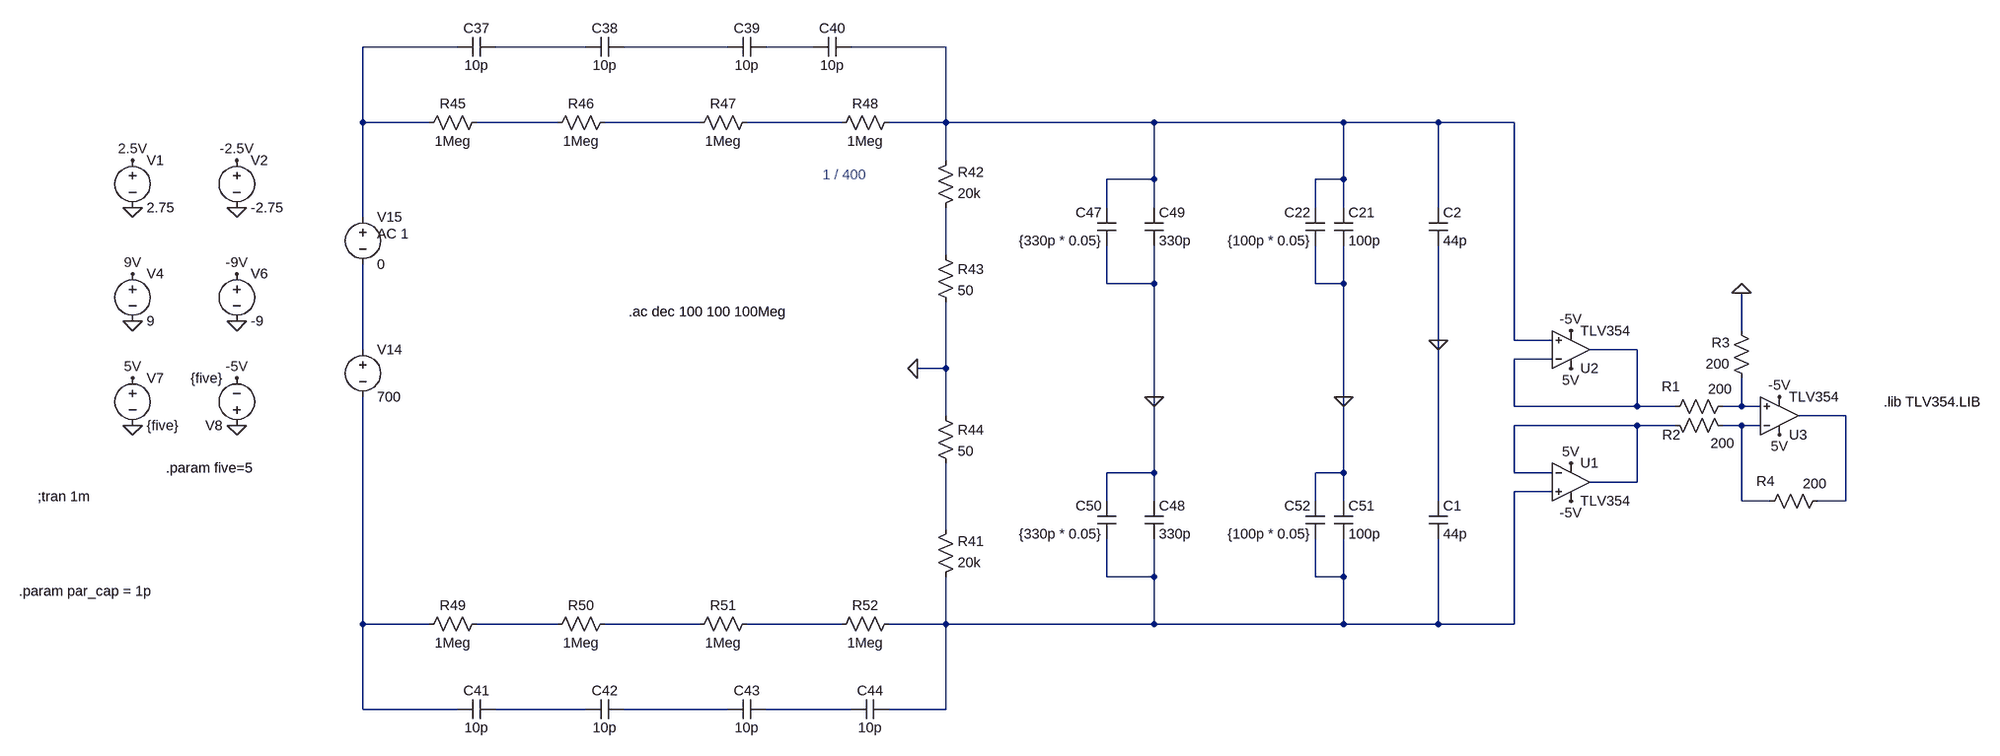
[diagram p0: schematic new.asc]
new.asc, the LTspice schematic file:
Version 4
SHEET 1 9284 2628
WIRE 544 -448 384 -448
WIRE 784 -448 608 -448
WIRE 1024 -448 848 -448
WIRE 1168 -448 1088 -448
WIRE 1392 -448 1232 -448
WIRE 384 -320 384 -448
WIRE 496 -320 384 -320
WIRE 736 -320 576 -320
WIRE 976 -320 816 -320
WIRE 1216 -320 1056 -320
WIRE 1392 -320 1392 -448
WIRE 1392 -320 1296 -320
WIRE 1744 -320 1392 -320
WIRE 2064 -320 1744 -320
WIRE 2224 -320 2064 -320
WIRE 2352 -320 2224 -320
WIRE 1392 -256 1392 -320
WIRE 1744 -224 1744 -320
WIRE 1744 -224 1664 -224
WIRE 2064 -224 2064 -320
WIRE 2064 -224 2016 -224
WIRE 1664 -176 1664 -224
WIRE 1744 -176 1744 -224
WIRE 2016 -176 2016 -224
WIRE 2064 -176 2064 -224
WIRE 2224 -176 2224 -320
WIRE 384 -160 384 -320
WIRE 1392 -96 1392 -176
WIRE 1664 -48 1664 -112
WIRE 1744 -48 1744 -112
WIRE 1744 -48 1664 -48
WIRE 2016 -48 2016 -112
WIRE 2064 -48 2064 -112
WIRE 2064 -48 2016 -48
WIRE 2736 32 2736 -32
WIRE 2224 48 2224 -112
WIRE 2352 48 2352 -320
WIRE 2416 48 2352 48
WIRE 384 64 384 -80
WIRE 2560 64 2480 64
WIRE 2416 80 2352 80
WIRE 1392 96 1392 -16
WIRE 1392 96 1344 96
WIRE 1744 144 1744 -48
WIRE 2064 144 2064 -48
WIRE 2352 160 2352 80
WIRE 2560 160 2560 64
WIRE 2560 160 2352 160
WIRE 2624 160 2560 160
WIRE 2736 160 2736 112
WIRE 2736 160 2704 160
WIRE 2768 160 2736 160
WIRE 1392 176 1392 96
WIRE 2912 176 2832 176
WIRE 2560 192 2352 192
WIRE 2624 192 2560 192
WIRE 2736 192 2704 192
WIRE 2768 192 2736 192
WIRE 1744 272 1744 144
WIRE 1744 272 1664 272
WIRE 2064 272 2064 144
WIRE 2064 272 2016 272
WIRE 2352 272 2352 192
WIRE 2416 272 2352 272
WIRE 2560 288 2560 192
WIRE 2560 288 2480 288
WIRE 2416 304 2352 304
WIRE 1664 320 1664 272
WIRE 1744 320 1744 272
WIRE 2016 320 2016 272
WIRE 2064 320 2064 272
WIRE 2224 320 2224 48
WIRE 2736 320 2736 192
WIRE 2784 320 2736 320
WIRE 2912 320 2912 176
WIRE 2912 320 2864 320
WIRE 1392 368 1392 256
WIRE 1664 448 1664 384
WIRE 1744 448 1744 384
WIRE 1744 448 1664 448
WIRE 2016 448 2016 384
WIRE 2064 448 2064 384
WIRE 2064 448 2016 448
WIRE 384 528 384 144
WIRE 496 528 384 528
WIRE 736 528 576 528
WIRE 976 528 816 528
WIRE 1216 528 1056 528
WIRE 1392 528 1392 448
WIRE 1392 528 1296 528
WIRE 1744 528 1744 448
WIRE 1744 528 1392 528
WIRE 2064 528 2064 448
WIRE 2064 528 1744 528
WIRE 2224 528 2224 384
WIRE 2224 528 2064 528
WIRE 2352 528 2352 304
WIRE 2352 528 2224 528
WIRE 384 672 384 528
WIRE 544 672 384 672
WIRE 784 672 608 672
WIRE 1024 672 848 672
WIRE 1232 672 1088 672
WIRE 1392 672 1392 528
WIRE 1392 672 1296 672
FLAG -80 -176 0
FLAG -80 -256 2.5V
FLAG 96 -176 0
FLAG 96 -256 -2.5V
FLAG -80 16 0
FLAG -80 -64 9V
FLAG 96 16 0
FLAG 96 -64 -9V
FLAG -80 192 0
FLAG -80 112 5V
FLAG 96 192 0
FLAG 96 112 -5V
FLAG 1344 96 0
FLAG 2224 48 0
FLAG 1744 144 0
FLAG 2064 144 0
FLAG 2448 256 5V
FLAG 2448 320 -5V
FLAG 2448 96 5V
FLAG 2448 32 -5V
FLAG 2800 208 5V
FLAG 2800 144 -5V
FLAG 2736 -32 0
SYMBOL voltage -80 -272 R0
SYMATTR InstName V1
SYMATTR Value 2.75
SYMBOL voltage 96 -272 R0
SYMATTR InstName V2
SYMATTR Value -2.75
SYMBOL voltage -80 -80 R0
SYMATTR InstName V4
SYMATTR Value 9
SYMBOL voltage 96 -80 R0
SYMATTR InstName V6
SYMATTR Value -9
SYMBOL voltage -80 96 R0
SYMATTR InstName V7
SYMATTR Value {five}
SYMBOL voltage 96 208 R180
WINDOW 123 0 0 Left 0
WINDOW 39 0 0 Left 0
SYMATTR InstName V8
SYMATTR Value {five}
SYMBOL res 1376 464 M180
WINDOW 0 36 76 Left 2
WINDOW 3 36 40 Left 2
SYMATTR InstName R41
SYMATTR Value 20k
SYMBOL cap 608 -464 R90
WINDOW 0 0 32 VBottom 2
WINDOW 3 32 32 VTop 2
SYMATTR InstName C37
SYMATTR Value 10p
SYMBOL cap 848 -464 R90
WINDOW 0 0 32 VBottom 2
WINDOW 3 32 32 VTop 2
SYMATTR InstName C38
SYMATTR Value 10p
SYMBOL cap 1088 -464 R90
WINDOW 0 0 32 VBottom 2
WINDOW 3 32 32 VTop 2
SYMATTR InstName C39
SYMATTR Value 10p
SYMBOL cap 1232 -464 R90
WINDOW 0 0 32 VBottom 2
WINDOW 3 32 32 VTop 2
SYMATTR InstName C40
SYMATTR Value 10p
SYMBOL cap 608 656 R90
WINDOW 0 0 32 VBottom 2
WINDOW 3 32 32 VTop 2
SYMATTR InstName C41
SYMATTR Value 10p
SYMBOL cap 848 656 R90
WINDOW 0 0 32 VBottom 2
WINDOW 3 32 32 VTop 2
SYMATTR InstName C42
SYMATTR Value 10p
SYMBOL cap 1088 656 R90
WINDOW 0 0 32 VBottom 2
WINDOW 3 32 32 VTop 2
SYMATTR InstName C43
SYMATTR Value 10p
SYMBOL cap 1296 656 R90
WINDOW 0 0 32 VBottom 2
WINDOW 3 32 32 VTop 2
SYMATTR InstName C44
SYMATTR Value 10p
SYMBOL res 1376 -160 M180
WINDOW 0 36 76 Left 2
WINDOW 3 36 40 Left 2
SYMATTR InstName R42
SYMATTR Value 20k
SYMBOL voltage 384 48 R0
WINDOW 123 0 0 Left 0
WINDOW 39 0 0 Left 0
SYMATTR InstName V14
SYMATTR Value 700
SYMBOL res 1376 -112 R0
SYMATTR InstName R43
SYMATTR Value 50
SYMBOL res 1376 160 R0
SYMATTR InstName R44
SYMATTR Value 50
SYMBOL cap 1728 -176 R0
SYMATTR InstName C49
SYMATTR Value 330p
SYMBOL res 592 -336 R90
WINDOW 0 0 56 VBottom 2
WINDOW 3 32 56 VTop 2
SYMATTR InstName R45
SYMATTR Value 1Meg
SYMBOL res 832 -336 R90
WINDOW 0 0 56 VBottom 2
WINDOW 3 32 56 VTop 2
SYMATTR InstName R46
SYMATTR Value 1Meg
SYMBOL res 1072 -336 R90
WINDOW 0 0 56 VBottom 2
WINDOW 3 32 56 VTop 2
SYMATTR InstName R47
SYMATTR Value 1Meg
SYMBOL res 1312 -336 R90
WINDOW 0 0 56 VBottom 2
WINDOW 3 32 56 VTop 2
SYMATTR InstName R48
SYMATTR Value 1Meg
SYMBOL res 592 512 R90
WINDOW 0 0 56 VBottom 2
WINDOW 3 32 56 VTop 2
SYMATTR InstName R49
SYMATTR Value 1Meg
SYMBOL res 832 512 R90
WINDOW 0 0 56 VBottom 2
WINDOW 3 32 56 VTop 2
SYMATTR InstName R50
SYMATTR Value 1Meg
SYMBOL res 1072 512 R90
WINDOW 0 0 56 VBottom 2
WINDOW 3 32 56 VTop 2
SYMATTR InstName R51
SYMATTR Value 1Meg
SYMBOL res 1312 512 R90
WINDOW 0 0 56 VBottom 2
WINDOW 3 32 56 VTop 2
SYMATTR InstName R52
SYMATTR Value 1Meg
SYMBOL voltage 384 -176 R0
WINDOW 123 24 44 Left 2
WINDOW 39 0 0 Left 0
SYMATTR Value2 AC 1
SYMATTR InstName V15
SYMATTR Value 0
SYMBOL cap 2048 -176 R0
SYMATTR InstName C21
SYMATTR Value 100p
SYMBOL cap 1680 -176 M0
SYMATTR InstName C47
SYMATTR Value {330p * 0.05}
SYMBOL cap 1728 320 R0
SYMATTR InstName C48
SYMATTR Value 330p
SYMBOL cap 1680 320 M0
SYMATTR InstName C50
SYMATTR Value {330p * 0.05}
SYMBOL cap 2032 -176 M0
SYMATTR InstName C22
SYMATTR Value {100p * 0.05}
SYMBOL cap 2048 320 R0
SYMATTR InstName C51
SYMATTR Value 100p
SYMBOL cap 2032 320 M0
SYMATTR InstName C52
SYMATTR Value {100p * 0.05}
SYMBOL OpAmps\\opamp2 2448 224 R0
SYMATTR InstName U1
SYMATTR Value TLV354
SYMBOL OpAmps\\opamp2 2448 128 M180
SYMATTR InstName U2
SYMATTR Value TLV354
SYMBOL OpAmps\\opamp2 2800 240 M180
SYMATTR InstName U3
SYMATTR Value TLV354
SYMBOL res 2720 144 R90
WINDOW 0 -2 103 VBottom 2
WINDOW 3 -29 20 VTop 2
SYMATTR InstName R1
SYMATTR Value 200
SYMBOL res 2720 208 M270
WINDOW 0 -16 102 VTop 2
WINDOW 3 1 16 VBottom 2
SYMATTR InstName R2
SYMATTR Value 200
SYMBOL res 2752 128 R180
WINDOW 0 36 76 Left 2
WINDOW 3 36 40 Left 2
SYMATTR InstName R3
SYMATTR Value 200
SYMBOL res 2880 304 R90
WINDOW 0 -2 103 VBottom 2
WINDOW 3 -29 20 VTop 2
SYMATTR InstName R4
SYMATTR Value 200
SYMBOL cap 2208 320 R0
SYMATTR InstName C1
SYMATTR Value 44p
SYMBOL cap 2208 -176 R0
SYMATTR InstName C2
SYMATTR Value 44p
TEXT -240 312 Left 2 !;tran 1m
TEXT -24 264 Left 2 !.param five=5
TEXT -272 472 Left 2 !.param par_cap = 1p
TEXT 1184 -232 Left 2 ;1 / 400
TEXT 856 0 Left 2 !.ac dec 100 100 100Meg
TEXT 2976 152 Left 2 !.lib TLV354.LIB

The netlist it stands for:
* new.asc
V1 2.5V 0 2.75
V2 -2.5V 0 -2.75
V4 9V 0 9
V6 -9V 0 -9
V7 5V 0 {five}
V8 0 -5V {five}
R41 N016 N017 20k
C37 N002 N001 10p
C38 N003 N002 10p
C39 N004 N003 10p
C40 N005 N004 10p
C41 N022 N018 10p
C42 N023 N022 10p
C43 N024 N023 10p
C44 N016 N024 10p
R42 N009 N005 20k
V14 N010 N018 700
R43 N009 0 50
R44 0 N017 50
C49 N005 0 330p
R45 N006 N001 1Meg
R46 N007 N006 1Meg
R47 N008 N007 1Meg
R48 N005 N008 1Meg
R49 N019 N018 1Meg
R50 N020 N019 1Meg
R51 N021 N020 1Meg
R52 N016 N021 1Meg
V15 N001 N010 0 AC 1
C21 N005 0 100p
C47 N005 0 {330p * 0.05}
C48 0 N016 330p
C50 0 N016 {330p * 0.05}
C22 N005 0 {100p * 0.05}
C51 0 N016 100p
C52 0 N016 {100p * 0.05}
XU1 N016 N014 5V -5V N014 TLV354  ; pins In+ In- V+ V- OUT
XU2 N005 N011 5V -5V N011 TLV354  ; pins In+ In- V+ V- OUT
XU3 N012 N015 5V -5V N013 TLV354  ; pins In+ In- V+ V- OUT
R1 N012 N011 200
R2 N015 N014 200
R3 N012 0 200
R4 N013 N015 200
C1 0 N016 44p
C2 N005 0 44p
;tran 1m
.param five=5
.param par_cap = 1p
* 1 / 400
.ac dec 100 100 100Meg
.lib TLV354.LIB
.backanno
.end